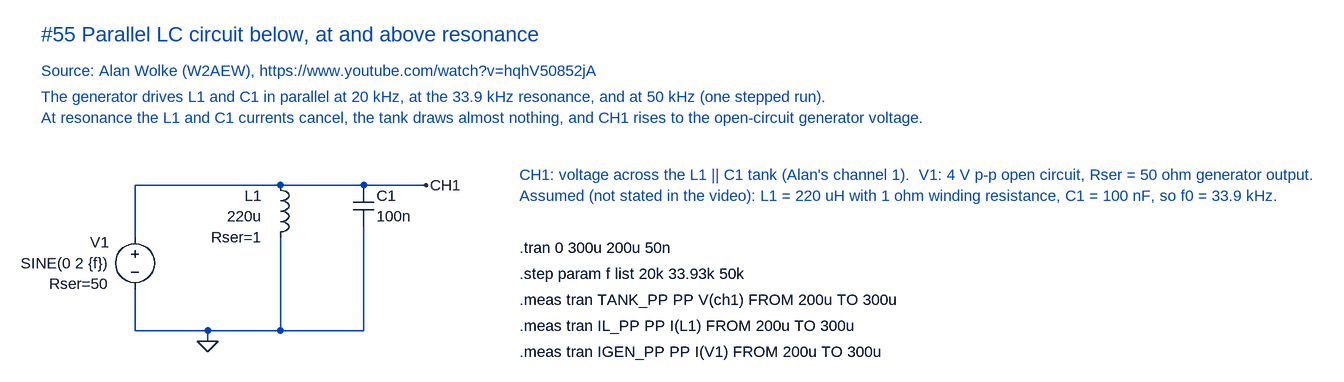
[diagram p0: schematic Parallel LC below at and above resonance.asc]
Parallel LC below at and above resonance.asc, the LTspice schematic file:
Version 4.1
SHEET 1 1400 700
WIRE 48 32 272 32
WIRE 272 32 400 32
WIRE 400 32 496 32
WIRE 48 32 48 112
WIRE 400 96 400 256
WIRE 272 112 272 256
WIRE 48 192 48 256
WIRE 48 256 160 256
WIRE 160 256 272 256
WIRE 272 256 400 256
WIRE 160 256 160 272
FLAG 160 272 0
FLAG 496 32 CH1
SYMBOL voltage 48 96 R0
WINDOW 0 -40 24 Right 2
WINDOW 3 -40 56 Right 2
WINDOW 123 0 0 Left 0
WINDOW 39 -40 88 Right 2
SYMATTR InstName V1
SYMATTR Value SINE(0 2 {f})
SYMATTR SpiceLine Rser=50
SYMBOL ind 256 16 R0
WINDOW 0 -12 32 Right 2
WINDOW 3 -12 64 Right 2
WINDOW 39 -12 96 Right 2
SYMATTR InstName L1
SYMATTR Value 220u
SYMATTR SpiceLine Rser=1
SYMBOL cap 384 32 R0
WINDOW 0 36 16 Left 2
WINDOW 3 36 48 Left 2
SYMATTR InstName C1
SYMATTR Value 100n
TEXT -96 -200 Left 3 ;#55 Parallel LC circuit below, at and above resonance
TEXT -96 -144 Left 2 ;Source: Alan Wolke (W2AEW), https://www.youtube.com/watch?v=hqhV50852jA
TEXT -96 -104 Left 2 ;The generator drives L1 and C1 in parallel at 20 kHz, at the 33.9 kHz resonance, and at 50 kHz (one stepped run).
TEXT -96 -72 Left 2 ;At resonance the L1 and C1 currents cancel, the tank draws almost nothing, and CH1 rises to the open-circuit generator voltage.
TEXT 640 16 Left 2 ;CH1: voltage across the L1 || C1 tank (Alan's channel 1).  V1: 4 V p-p open circuit, Rser = 50 ohm generator output.
TEXT 640 48 Left 2 ;Assumed (not stated in the video): L1 = 220 uH with 1 ohm winding resistance, C1 = 100 nF, so f0 = 33.9 kHz.
TEXT 640 128 Left 2 !.tran 0 300u 200u 50n
TEXT 640 168 Left 2 !.step param f list 20k 33.93k 50k
TEXT 640 208 Left 2 !.meas tran TANK_PP PP V(ch1) FROM 200u TO 300u
TEXT 640 248 Left 2 !.meas tran IL_PP PP I(L1) FROM 200u TO 300u
TEXT 640 288 Left 2 !.meas tran IGEN_PP PP I(V1) FROM 200u TO 300u

The netlist it stands for:
* Parallel LC below at and above resonance.asc
V1 CH1 0 SINE(0 2 {f}) Rser=50
L1 CH1 0 220u Rser=1
C1 CH1 0 100n
* #55 Parallel LC circuit below, at and above resonance
* Source: Alan Wolke (W2AEW), https://www.youtube.com/watch?v=hqhV50852jA
* The generator drives L1 and C1 in parallel at 20 kHz, at the 33.9 kHz resonance, and at 50 kHz (one stepped run).
* At resonance the L1 and C1 currents cancel, the tank draws almost nothing, and CH1 rises to the open-circuit generator voltage.
* CH1: voltage across the L1 || C1 tank (Alan's channel 1).  V1: 4 V p-p open circuit, Rser = 50 ohm generator output.
* Assumed (not stated in the video): L1 = 220 uH with 1 ohm winding resistance, C1 = 100 nF, so f0 = 33.9 kHz.
.tran 0 300u 200u 50n
.step param f list 20k 33.93k 50k
.meas tran TANK_PP PP V(ch1) FROM 200u TO 300u
.meas tran IL_PP PP I(L1) FROM 200u TO 300u
.meas tran IGEN_PP PP I(V1) FROM 200u TO 300u
.backanno
.end